# Altium schematic sheet 4-GPS.SchDoc: GPS Module
size A4; Organization: Unival Logistics; Address1: 550 S Hill St.; Address2: Suite 1607; Address3: Los Angeles, CA 90013; Revision: A; SheetNumber: 5; SheetTotal: 6
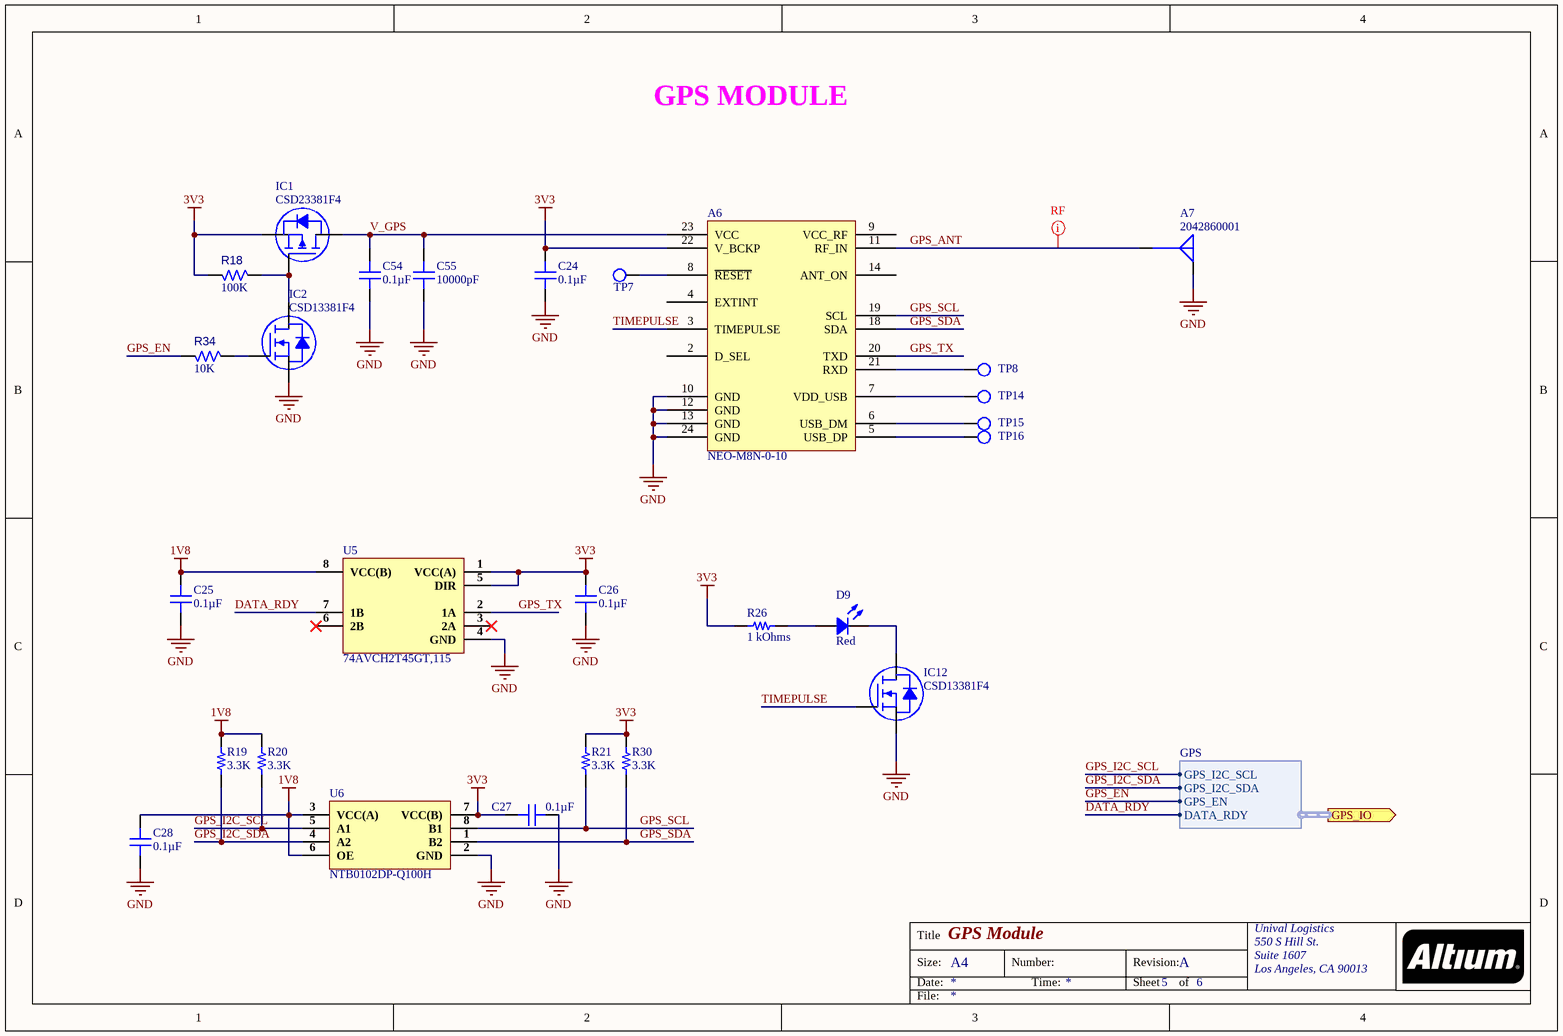
[diagram p0: 4-GPS.SchDoc]

## Parts
A6  NEO-M8N-0-10  [U-BLOX NEO-M8N]
A7  2042860001  [MOLEX 2042860001]
C24  0.1µF  [CAP 0201_0603]
C25  0.1µF  [CAP 0201_0603]
C26  0.1µF  [CAP 0201_0603]
C27  0.1µF  [CAP 0201_0603]
C28  0.1µF  [CAP 0201_0603]
C54  0.1µF  [CAP 0201_0603]
C55  10000pF  [CAP 0201_0603]
D9  Red  [LED 0402_1005 RED]
IC1  CSD23381F4  [TI 3-XFDFN F4 YJC]
IC2  CSD13381F4  [TI 3-XFDFN F4 YJC]
IC12  CSD13381F4  [TI 3-XFDFN F4 YJC]
R18  100K  [RES 0201_0603]
R19  3.3K  [RES 0201_0603]
R20  3.3K  [RES 0201_0603]
R21  3.3K  [RES 0201_0603]
R26  1 kOhms  [RES 0201_0603]
R30  3.3K  [RES 0201_0603]
R34  10K  [RES 0201_0603]
TP7  Test Point  [Test Point]  (value not drawn)  (no BOM)
TP8  Test Point  [Test Point]  (value not drawn)  (no BOM)
TP14  Test Point  [Test Point]  (value not drawn)  (no BOM)
TP15  Test Point  [Test Point]  (value not drawn)  (no BOM)
TP16  Test Point  [Test Point]  (value not drawn)  (no BOM)
U5  74AVCH2T45GT,115  [74AVCH2T45GT,115]
U6  NTB0102DP-Q100H  [NTB0102DP-Q100H]

## Ports
GPS_IO (out, harness GPS)

## Harnesses
GPS: GPS_I2C_SCL, GPS_I2C_SDA, GPS_EN, DATA_RDY

## Nets
1V8: C25.2 C28.2 R19.1 R20.1 U5.8(VCC(B)) U6.3(VCC(A)) U6.6(OE)
3V3: A6.22(V_BCKP) C24.2 C26.2 C27.2 IC1.S R18.2 R21.1 R26.1 R30.1 U5.1(VCC(A)) U5.5(DIR) U6.7(VCC(B))
GND: A6.10(GND) A6.12(GND) A6.13(GND) A6.24(GND) A7.G C24.1 C25.1 C26.1 C27.1 C28.1 C54.1 C55.1 IC2.S IC12.S U5.4(GND) U6.2(GND)
DATA_RDY: U5.7(1B) ; port GPS_IO.DATA_RDY
GPS_ANT: A6.11(RF_IN) A7.S
GPS_EN: R34.1 ; port GPS_IO.GPS_EN
GPS_I2C_SCL: R20.2 U6.5(A1) ; port GPS_IO.GPS_I2C_SCL
GPS_I2C_SDA: R19.2 U6.4(A2) ; port GPS_IO.GPS_I2C_SDA
GPS_SCL: A6.19(SCL) R21.2 U6.8(B1)
GPS_SDA: A6.18(SDA) R30.2 U6.1(B2)
GPS_TX: A6.20(TXD) U5.2(1A)
TIMEPULSE: A6.3(TIMEPULSE) IC12.G
V_GPS: A6.23(VCC) C54.2 C55.2 IC1.D
NetA6_5: A6.5(USB_DP) TP16.1(TP)
NetA6_6: A6.6(USB_DM) TP15.1(TP)
NetA6_7: A6.7(VDD_USB) TP14.1(TP)
NetA6_8: A6.8(~{RESET}) TP7.1(TP)
NetA6_21: A6.21(RXD) TP8.1(TP)
NetD9_1: D9.1 R26.2
NetD9_2: D9.2 IC12.D
NetIC1_G: IC1.G IC2.D R18.1
NetIC2_G: IC2.G R34.2

Not connected (* = marked no-connect by the designer): A6 2(D_SEL) 4(EXTINT) 9(VCC_RF) 14(ANT_ON); U5 3(2A)* 6(2B)*

## Layout directives
net class RF: GPS_ANT

## Notes on the sheet
- GPS MODULE
- Title
- Size:
- Date:
- A4
- Number:
- Time:
- Revision:
- Sheet
- of
- File:

## Library data of the parts
A6 = U-BLOX NEO-M8N: RF RCVR GNSS/GPS 1.575GHZ 24LCC; Manufacturer: U-Blox America Inc.; Current - Receiving: 21mA; Data Interface: I2C, SPI, UART, USB; Modulation or Protocol: BeiDou, Galileo, GLONASS, GNSS, GPS; Sensitivity: -167dBm; Voltage - Supply: 1.65V ~ 3.6V; Part Number: NEO-M8N-0-10; Applications: General Purpose; ComponentLink1Description: Datasheet; ComponentLink1URL: https://www.u-blox.com/sites/default/files/NEO-M8-FW3_DataSheet_%28UBX-15031086%29.pdf; ComponentLink2Description: DigiKey Link; ComponentLink2URL: http://digikey.com/product-detail/en/u-blox-america-inc/NEO-M8N-0-10/672-NEO-M8N-0-10CT-ND/6150671; Device Package: 24-SMD Module; Frequency: 1.575GHz; LastUpdated: 04/01/2020 00:19:34; Lifecycle Status: Active; Minimum Order: 1; Operating Temperature: -40°C ~ 85°C; Package / Case: 24-SMD Module; Packaging: ReReel; PartId: 3; Part Status: Active; Price: 0.00; Series: NEO-M8; Supplier 1: DigiKey; Supplier Part Number 1: 672-NEO-M8N-0-10CT-ND
A7 = Basic Antenna: RF ANT CER PATCH SOLDER SMD; Manufacturer: Molex; Antenna Type: Ceramic Patch; Frequency Group: UHF (1GHz ~ 2GHz); Gain: 5.5dBi; Number of Bands: 1; Return Loss: -10dB; RF Family/Standard: Navigation; Part Number: 2042860001; Applications: Beidou, GLONASS, GPS; ComponentLink1Description: Datasheet; ComponentLink1URL: http://www.literature.molex.com/SQLImages/kelmscott/Molex/PDF_Images/987651-5071.pdf; ComponentLink2Description: DigiKey Link; ComponentLink2URL: http://digikey.com/product-detail/en/molex/2042860001/WM16802-ND/7566910; Height (Max): 0.157" (4.00mm); LastUpdated: 12/12/2019 06:31:41; Lifecycle Status: 0; Minimum Order: 1; Mounting Type: Through Hole; Packaging: Tray; Part Status: Active; Price: 2.23; Series: *; Supplier 1: DigiKey; Supplier Part Number 1: WM16802-ND; Termination: Solder
C24-C28 C54 = Capacitor: CAP CER 0.1UF 16V X5R 0201; Part Number: GRM033R61C104ME84D; Manufacturer: Murata Electronics; Tolerance: ±20%; Value: 0.1µF; Applications: General Purpose; Capacitance: 0.1µF; ComponentLink1Description: Datasheet; ComponentLink1URL: https://search.murata.co.jp/Ceramy/image/img/A01X/G101/ENG/GRM033R61C104ME84-01.pdf; ComponentLink2Description: DigiKey Link; ComponentLink2URL: http://digikey.com/product-detail/en/murata-electronics/GRM033R61C104ME84D/490-9986-1-ND/5026291; Device Package: 0201 (0603 Metric); LastUpdated: 21/01/2020 00:00:12; Lifecycle Status: Active; Minimum Order: 1; Mounting Type: Surface Mount, MLCC; Operating Temperature: -55°C ~ 85°C; Package / Case: 0201 (0603 Metric); Packaging: TapeAndReel; PartId: 1522; Part Status: Active; Price: 0.01; Series: GRM; Size / Dimension: 0.024" L x 0.012" W (0.60mm x 0.30mm); Supplier 1: DigiKey; Supplier Part Number 1: 490-9986-1-ND; Temperature Coefficient: X5R; Thickness (Max): 0.013" (0.33mm); Voltage - Rated: 16V
C55 = Capacitor: CAP CER 10000PF 6.3V X7R 0201; Part Number: CGA1A2X7R0J103M030BA; Manufacturer: TDK Corporation; Tolerance: ±20%; Value: 10000pF; Applications: Automotive; Capacitance: 10000pF; ComponentLink1Description: Datasheet; ComponentLink1URL: https://product.tdk.com/info/en/catalog/datasheets/mlcc_automotive_general_en.pdf?ref_disty=digikey; ComponentLink2Description: DigiKey Link; ComponentLink2URL: http://digikey.com/product-detail/en/tdk-corporation/CGA1A2X7R0J103M030BA/445-12116-1-ND/3953782; Device Package: 0201 (0603 Metric); LastUpdated: 21/01/2020 00:00:11; Lifecycle Status: Active; Minimum Order: 1; Mounting Type: Surface Mount, MLCC; Operating Temperature: -55°C ~ 125°C; Package / Case: 0201 (0603 Metric); Packaging: TapeAndReel; PartId: 1683; Part Status: Active; Price: 0.01; Ratings: AEC-Q200; Series: CGA; Size / Dimension: 0.024" L x 0.012" W (0.60mm x 0.30mm); Supplier 1: DigiKey; Supplier Part Number 1: 445-12116-1-ND; Temperature Coefficient: X7R; Thickness (Max): 0.013" (0.33mm); Voltage - Rated: 6.3V
D9 = LED: LED RED CLEAR 0402 SMD; Part Number: IN-S42ATR; Manufacturer: Inolux; Configuration: Standard; Current - Test: 20mA; Lens Size: 0.60mm x 0.45mm; Lens Style: Rectangle with Flat Top; Millicandela Rating: 90mcd; Viewing Angle: 130°; Voltage - Forward (Vf) (Typ): 2.1V; Wavelength - Dominant: 631nm; Wavelength - Peak: 645nm; Color: Red; ComponentLink1Description: Datasheet; ComponentLink1URL: http://www.inolux-corp.com/datasheet/SMDLED/Mono%20Color%20Top%20View/IN-S42AT%20Series_V1.1.pdf; ComponentLink2Description: DigiKey Link; ComponentLink2URL: http://digikey.com/product-detail/en/inolux/IN-S42ATR/1830-1057-1-ND/7604692; Device Package: 0402 (1005 Metric); Height (Max): 0.55mm; LastUpdated: 21/01/2020 03:12:45; Lens Color: Clear; Lens Transparency: Clear; Lifecycle Status: Active; Minimum Order: 1; Mounting Type: Surface Mount; Package / Case: 0402 (1005 Metric); Packaging: TapeAndReel; PartId: 504; Part Status: Active; Price: 0.06; Series: IN-S42AT; Size / Dimension: 1.00mm L x 0.50mm W; Supplier 1: DigiKey; Supplier Part Number 1: 1830-1057-1-ND; Supplier Device Package: 0402; Value: Red
IC1 = TI CSD MOSFET P-CH: MOSFET P-CH 12V 2.3A 3PICOSTAR; Current - Continuous Drain (Id) @ 25°C: 2.3A (Ta); Drive Voltage (Max Rds On,  Min Rds On): 1.8V, 4.5V; FET Type: P-Channel; Power Dissipation (Max): 500mW (Ta); Rds On (Max) @ Id, Vgs: 180mOhm @ 500mA, 4.5V; Vgs (Max): -8V; Vgs(th) (Max) @ Id: 1.2V @ 250µA; Part Number: CSD23381F4; ComponentLink1Description: Datasheet; ComponentLink1URL: http://www.ti.com/general/docs/suppproductinfo.tsp?distId=10&gotoUrl=http%3A%2F%2Fwww.ti.com%2Flit%2Fgpn%2Fcsd13381f4; ComponentLink2Description: DigiKey Link; ComponentLink2URL: http://digikey.com/product-detail/en/texas-instruments/CSD13381F4/296-38912-1-ND/5143018; Device Package: 3-XFDFN; Drain to Source Voltage (Vdss): 12V; Package / Case: 3-XFDFN; Packaging: TapeAndReel; Part Status: Active; Price: 0.07; Series: NexFET™; Supplier 1: DigiKey; Supplier Part Number 1: 296-40002-2-ND; Supplier Device Package: 3-PICOSTAR; Technology: MOSFET (Metal Oxide)
IC2 IC12 = TI CSD MOSFET N-CH F4: MOSFET N-CH 12V 2.1A 3PICOSTAR; Manufacturer: Texas Instruments; Current - Continuous Drain (Id) @ 25°C: 2.1A (Ta); Drive Voltage (Max Rds On,  Min Rds On): 1.8V, 4.5V; FET Type: N-Channel; Gate Charge (Qg) (Max) @ Vgs: 1.4nC @ 4.5V; Input Capacitance (Ciss) (Max) @ Vds: 200pF @ 6V; Power Dissipation (Max): 500mW (Ta); Rds On (Max) @ Id, Vgs: 180mOhm @ 500mA, 4.5V; Vgs (Max): 8V; Vgs(th) (Max) @ Id: 1.1V @ 250µA; Part Number: CSD13381F4; ComponentLink1Description: Datasheet; ComponentLink1URL: http://www.ti.com/general/docs/suppproductinfo.tsp?distId=10&gotoUrl=http%3A%2F%2Fwww.ti.com%2Flit%2Fgpn%2Fcsd13381f4; ComponentLink2Description: DigiKey Link; ComponentLink2URL: http://digikey.com/product-detail/en/texas-instruments/CSD13381F4/296-38912-1-ND/5143018; Device Package: 3-XFDFN; Drain to Source Voltage (Vdss): 12V; LastUpdated: 30/03/2020 15:00:54; Lifecycle Status: Active; Minimum Order: 1; Mounting Type: Surface Mount; Operating Temperature: -55°C ~ 150°C (TJ); Package / Case: 3-XFDFN; Packaging: TapeAndReel; Part Status: Active; Price: 0.07; Series: NexFET™; Supplier 1: DigiKey; Supplier Part Number 1: 296-38912-1-ND; Supplier Device Package: 3-PICOSTAR; Technology: MOSFET (Metal Oxide)
R18 = RSMT0626: RES 100K OHM 1% 1/20W 0201; Part Number: RMCF0201FT100K; Manufacturer: Stackpole Electronics Inc; Value: 100K; Supplier Part Number 1: RMCF0201FT100KTR-ND; ComponentLink1URL: https://chn-vm-apps.microchip.com/mchprepo/parts/Datasheets/AOA0000CE2.pdf; ComponentLink1Description: Datasheet; Supplier 1: Digi-Key
R19-R21 R30 = Resistor: RES SMD 3.3K OHM 1% 1/20W 0201; Part Number: ERJ-1GNF3301C; Manufacturer: Panasonic Electronic Components; Power (Watts): 0.05W, 1/20W; Resistance: 3.3 kOhms; Temperature Coefficient: ±200ppm/°C; Value: 3.3K; ComponentLink1Description: Datasheet; ComponentLink1URL: https://industrial.panasonic.com/cdbs/www-data/pdf/RDA0000/AOA0000C304.pdf; ComponentLink2Description: DigiKey Link; ComponentLink2URL: http://digikey.com/product-detail/en/panasonic-electronic-components/ERJ-1GNF3301C/P122937CT-ND/8342813; Composition: Thick Film; Device Package: 0201 (0603 Metric); Features: Automotive AEC-Q200; Height - Seated (Max): 0.010" (0.26mm); LastUpdated: 21/01/2020 00:04:10; Lifecycle Status: Active; Minimum Order: 1; Number of Terminations: 2; Operating Temperature: -55°C ~ 125°C; Package / Case: 0201 (0603 Metric); Packaging: TapeAndReel; PartId: 4142; Part Status: Active; Price: 0.01; Ratings: AEC-Q200; Series: ERJ; Size / Dimension: 0.024" L x 0.012" W (0.60mm x 0.30mm); Supplier 1: DigiKey; Supplier Part Number 1: P122937CT-ND; Supplier Device Package: 0201; Tolerance: ±1%
R26 = Resistor: RES SMD 1K OHM 1% 1/20W 0201; Part Number: ERJ-1GNF1001C; Manufacturer: Panasonic Electronic Components; Power (Watts): 0.05W, 1/20W; Temperature Coefficient: ±200ppm/°C; Value: 1 kOhms; ComponentLink1Description: Datasheet; ComponentLink1URL: https://industrial.panasonic.com/cdbs/www-data/pdf/RDA0000/AOA0000C304.pdf; ComponentLink2Description: DigiKey Link; ComponentLink2URL: http://digikey.com/product-detail/en/panasonic-electronic-components/ERJ-1GNF1001C/P122413CT-ND/7389439; Composition: Thick Film; Device Package: 0201 (0603 Metric); Features: Automotive AEC-Q200; Height - Seated (Max): 0.010" (0.26mm); LastUpdated: 21/01/2020 00:04:13; Lifecycle Status: Active; Minimum Order: 1; Number of Terminations: 2; Operating Temperature: -55°C ~ 125°C; Package / Case: 0201 (0603 Metric); Packaging: TapeAndReel; PartId: 2298; Part Status: Active; Price: 0.01; Ratings: AEC-Q200; Resistance: 1 kOhms; Series: ERJ; Size / Dimension: 0.024" L x 0.012" W (0.60mm x 0.30mm); Supplier 1: DigiKey; Supplier Part Number 1: P122413CT-ND; Supplier Device Package: 0201; Tolerance: ±1%
R34 = RSMT0626: RES SMD 10K OHM 1% 1/20W 0201; Part Number: RC0201FR-0710KL; Manufacturer: Yageo; Value: 10K; Supplier Part Number 1: 311-10.0KMTR-ND; ComponentLink1URL: https://chn-vm-apps.microchip.com/mchprepo/parts/Datasheets/AOA0000CE2.pdf; ComponentLink1Description: Datasheet; Supplier 1: Digi-Key
U5 = 74AVCH2T45GT,115: IC TXRX BUS 2BIT DUAL 3ST 8XSON; Manufacturer: Nexperia; Supplier 1: Digi-Key; Manufacturer Part Number: 74AVCH2T45GT,115; RoHS: Yes; Category: Voltage Level Shifters; Stock 1: 342616; Pricing 1: 5000=0.19239 (USD); RoHS Compliant: Yes; ComponentLink1URL: https://assets.nexperia.com/documents/data-sheet/74AVCH2T45.pdf?src-supplier=Digi-Key; ComponentLink1Description: https://assets.nexperia.com/documents/data-sheet/74AVCH2T45.pdf?src-supplier=Digi-Key; Supplier Part Number 1: 1727-6903-2-ND
U6 = NTB0102DP-Q100H: Voltage Level Translator 2-CH Bidirectional Automotive 8-Pin TSSOP T/R; Manufacturer: NXP Semiconductors; Propagation Delay: 4.4ns; Data Rate: 100Mbps; Number of Channels: 2; Max Supply Voltage: 3.6V; Min Supply Voltage: 1.2V; Max Power Dissipation: 250mW; Nominal Supply Current: 3.3uA; Number of Circuits: 1; Turn-On Delay Time: 5.9ns; Low Level Output Current: 20uA; High Level Output Current: -20uA; Supplier 1: Digi-Key; Manufacturer Part Number: NTB0102DP-Q100H; RoHS: Yes; Category: Logic Gates; Stock 1: 8500; Pricing 1: 1=1.30000, 10=1.16200, 25=1.10240, 100=1.06880 (USD); Mount: Surface Mount; Case/Package: TSSOP; Number of Pins: 8; Min Operating Temperature: -40°C; Max Operating Temperature: 125°C; Packaging: Tape and Reel; Package Quantity: 3000; Channel Type: Bidirectional; Logic Function: Translator; Number of Bits: 2; Output Type: Voltage; Radiation Hardening: No; RoHS Compliant: Yes; ComponentLink1URL: https://datasheet.ciiva.com/29887/ntb0102-q100-29887588.pdf?src-supplier=Avnet; ComponentLink1Description: https://datasheet.ciiva.com/29887/ntb0102-q100-29887588.pdf?src-supplier=Avnet; ComponentLink2URL: https://datasheet.ciiva.com/29615/ntb0102-q100-29615979.pdf?src-supplier=Digi-Key; ComponentLink2Description: https://datasheet.ciiva.com/29615/ntb0102-q100-29615979.pdf?src-supplier=Digi-Key; Supplier Part Number 1: 568-12374-6-ND